# Altium schematic sheet Connection_scheme.SchDoc: =DT_SCH_Title
size A3; Organization: Droid Technologies; SheetNumber: 2; SheetTotal: 22
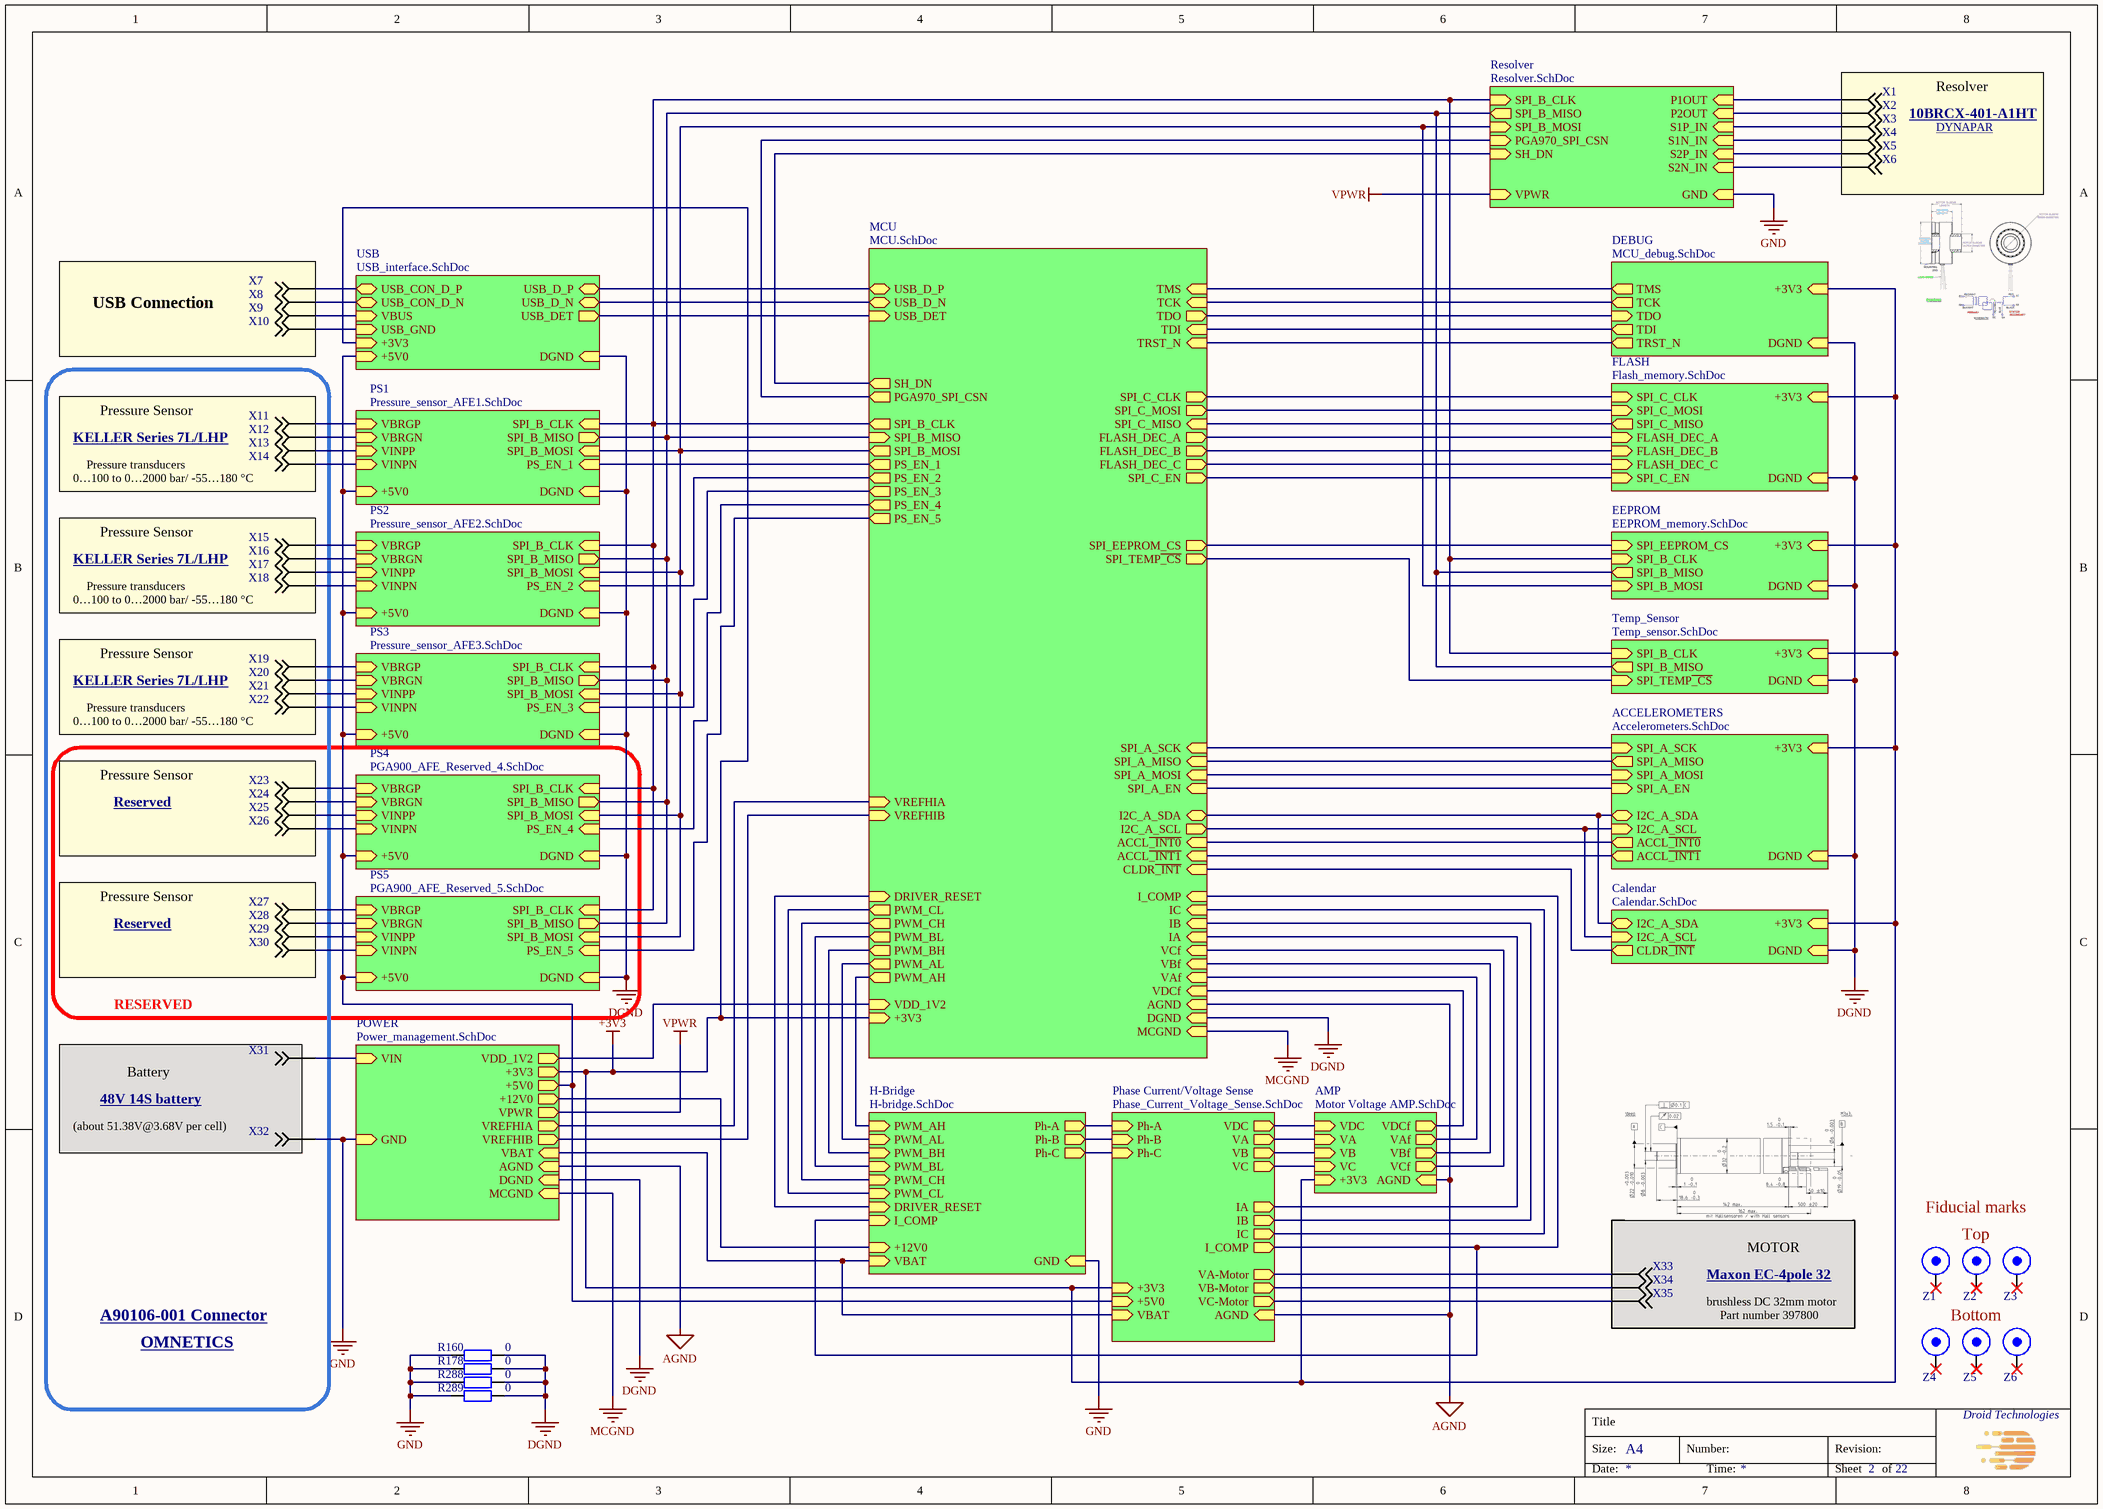
[diagram p0: Connection_scheme.SchDoc]

## Parts
R160  Resistance: 0  [RESC160X80X55L30]  (hidden comment: RC0603FR-070RL)
R178  Resistance: 0  [RESC160X80X55L30]  (hidden comment: RC0603FR-070RL)
R288  Resistance: 0  [RESC160X80X55L30]  (hidden comment: RC0603FR-070RL)
R289  Resistance: 0  [RESC160X80X55L30]  (hidden comment: RC0603FR-070RL)
X1  PIN-TH-0.6mm  [PIN-TH-0.6mm]  (value not drawn)  (no BOM)
X2  PIN-TH-0.6mm  [PIN-TH-0.6mm]  (value not drawn)  (no BOM)
X3  PIN-TH-0.6mm  [PIN-TH-0.6mm]  (value not drawn)  (no BOM)
X4  PIN-TH-0.6mm  [PIN-TH-0.6mm]  (value not drawn)  (no BOM)
X5  PIN-TH-0.6mm  [PIN-TH-0.6mm]  (value not drawn)  (no BOM)
X6  PIN-TH-0.6mm  [PIN-TH-0.6mm]  (value not drawn)  (no BOM)
X7  PIN-TH-0.6mm  [PIN-TH-0.6mm]  (value not drawn)  (no BOM)
X8  PIN-TH-0.6mm  [PIN-TH-0.6mm]  (value not drawn)  (no BOM)
X9  PIN-TH-0.6mm  [PIN-TH-0.6mm]  (value not drawn)  (no BOM)
X10  PIN-TH-0.6mm  [PIN-TH-0.6mm]  (value not drawn)  (no BOM)
X11  PIN-TH-0.6mm  [PIN-TH-0.6mm]  (value not drawn)  (no BOM)
X12  PIN-TH-0.6mm  [PIN-TH-0.6mm]  (value not drawn)  (no BOM)
X13  PIN-TH-0.6mm  [PIN-TH-0.6mm]  (value not drawn)  (no BOM)
X14  PIN-TH-0.6mm  [PIN-TH-0.6mm]  (value not drawn)  (no BOM)
X15  PIN-TH-0.6mm  [PIN-TH-0.6mm]  (value not drawn)  (no BOM)
X16  PIN-TH-0.6mm  [PIN-TH-0.6mm]  (value not drawn)  (no BOM)
X17  PIN-TH-0.6mm  [PIN-TH-0.6mm]  (value not drawn)  (no BOM)
X18  PIN-TH-0.6mm  [PIN-TH-0.6mm]  (value not drawn)  (no BOM)
X19  PIN-TH-0.6mm  [PIN-TH-0.6mm]  (value not drawn)  (no BOM)
X20  PIN-TH-0.6mm  [PIN-TH-0.6mm]  (value not drawn)  (no BOM)
X21  PIN-TH-0.6mm  [PIN-TH-0.6mm]  (value not drawn)  (no BOM)
X22  PIN-TH-0.6mm  [PIN-TH-0.6mm]  (value not drawn)  (no BOM)
X23  PIN-TH-0.6mm  [PIN-TH-0.6mm]  (value not drawn)  (no BOM)
X24  PIN-TH-0.6mm  [PIN-TH-0.6mm]  (value not drawn)  (no BOM)
X25  PIN-TH-0.6mm  [PIN-TH-0.6mm]  (value not drawn)  (no BOM)
X26  PIN-TH-0.6mm  [PIN-TH-0.6mm]  (value not drawn)  (no BOM)
X27  PIN-TH-0.6mm  [PIN-TH-0.6mm]  (value not drawn)  (no BOM)
X28  PIN-TH-0.6mm  [PIN-TH-0.6mm]  (value not drawn)  (no BOM)
X29  PIN-TH-0.6mm  [PIN-TH-0.6mm]  (value not drawn)  (no BOM)
X30  PIN-TH-0.6mm  [PIN-TH-0.6mm]  (value not drawn)  (no BOM)
X31  PinTH_0.9mm  [PIN-TH-0.9mm]  (value not drawn)  (no BOM)
X32  PinTH_0.9mm  [PIN-TH-0.9mm]  (value not drawn)  (no BOM)
X33  PinTH_0.9mm  [PIN-TH-0.9mm]  (value not drawn)  (no BOM)
X34  PinTH_0.9mm  [PIN-TH-0.9mm]  (value not drawn)  (no BOM)
X35  PinTH_0.9mm  [PIN-TH-0.9mm]  (value not drawn)  (no BOM)
Z1  Fiducial  [REPER1.2]  (value not drawn)  (no BOM)
Z2  Fiducial  [REPER1.2]  (value not drawn)  (no BOM)
Z3  Fiducial  [REPER1.2]  (value not drawn)  (no BOM)
Z4  Fiducial  [REPER1.2]  (value not drawn)  (no BOM)
Z5  Fiducial  [REPER1.2]  (value not drawn)  (no BOM)
Z6  Fiducial  [REPER1.2]  (value not drawn)  (no BOM)

## Blocks framed on the sheet
USB Connection: X7-X10

## Sub-sheets
ACCELEROMETERS = Accelerometers.SchDoc: SPI_A_EN (in), SPI_A_MISO (out), SPI_A_MOSI (in), SPI_A_SCK (in), ACCL~{_INT0} (out), ACCL~{_INT1} (out), +3V3 (in), DGND (in), I2C_A_SCL (in), I2C_A_SDA (bidir)
AMP = Motor Voltage AMP.SchDoc: VA (in), VB (in), VC (in), VDC (in), VAf (out), VBf (out), VCf (out), VDCf (out), +3V3 (in), AGND (in)
Calendar = Calendar.SchDoc: CLDR~{_INT} (out), +3V3 (in), DGND (in), I2C_A_SCL (in), I2C_A_SDA (bidir)
DEBUG = MCU_debug.SchDoc: +3V3 (in), TMS (out), TCK (out), TDO (in), TDI (out), TRST_N (out), DGND (in)
EEPROM = EEPROM_memory.SchDoc: SPI_EEPROM_CS (in), SPI_B_CLK (in), SPI_B_MOSI (in), SPI_B_MISO (out), +3V3 (in), DGND (in)
FLASH = Flash_memory.SchDoc: SPI_C_CLK (in), SPI_C_MOSI (in), SPI_C_MISO (out), FLASH_DEC_A (in), FLASH_DEC_B (in), FLASH_DEC_C (in), SPI_C_EN (in), +3V3 (in), DGND (in)
H-Bridge = H-bridge.SchDoc: PWM_AH (in), PWM_AL (in), PWM_BH (in), PWM_BL (in), PWM_CH (in), PWM_CL (in), DRIVER_RESET (in), +12V0 (in), VBAT (in), Ph-A (out), Ph-B (out), Ph-C (out), GND (in), I_COMP (in)
MCU = MCU.SchDoc: TMS (in), TCK (in), TDO (out), TDI (in), TRST_N (in), +3V3 (in), DGND (in), USB_D_P (bidir), USB_D_N (bidir), VAf (in), VBf (in), VCf (in), IA (in), IB (in), IC (in), I_COMP (in), VDCf (in), PS_EN_1 (out), SPI_B_CLK (out), SPI_B_MISO (in), SPI_B_MOSI (out), PS_EN_2 (out), PS_EN_3 (out), SPI_C_CLK (out), SPI_C_MOSI (out), SPI_C_MISO (in), FLASH_DEC_A (out), FLASH_DEC_B (out), FLASH_DEC_C (out), SPI_C_EN (out), I2C_A_SCL (out), I2C_A_SDA (bidir), ACCL~{_INT1} (in), ACCL~{_INT0} (in), CLDR~{_INT} (in), VREFHIA (in), VREFHIB (in), PWM_AH (out), PWM_AL (out), PWM_BH (out), PWM_BL (out), PWM_CH (out), PWM_CL (out), DRIVER_RESET (in), PS_EN_4 (out), PS_EN_5 (out), USB_DET (in), VDD_1V2 (in), SH_DN (out), PGA970_SPI_CSN (out), SPI_A_EN (in), SPI_A_MISO (in), SPI_A_MOSI (in), SPI_A_SCK (in), SPI_EEPROM_CS (out), SPI_TEMP~{_CS} (out), AGND (in), MCGND (in)
Phase Current/Voltage Sense = Phase_Current_Voltage_Sense.SchDoc: Ph-A (in), Ph-B (in), Ph-C (in), VA (out), VB (out), VC (out), IA (out), IB (out), IC (out), VA-Motor (out), VB-Motor (out), VC-Motor (out), +5V0 (in), VBAT (in), +3V3 (in), I_COMP (out), AGND (in), VDC (out)
POWER = Power_management.SchDoc: GND (in), VPWR (out), +3V3 (out), VDD_1V2 (out), +5V0 (out), +12V0 (out), VIN (in), VREFHIA (out), VREFHIB (out), VBAT (in), MCGND (in), AGND (in), DGND (in)
PS1 = Pressure_sensor_AFE1.SchDoc: PS_EN_1 (in), SPI_B_CLK (in), SPI_B_MISO (out), SPI_B_MOSI (in), VBRGP (in), VBRGN (in), VINPP (in), VINPN (in), DGND (in), +5V0 (in)
PS2 = Pressure_sensor_AFE2.SchDoc: PS_EN_2 (in), SPI_B_CLK (in), SPI_B_MISO (out), SPI_B_MOSI (in), VBRGP (in), VBRGN (in), VINPP (in), VINPN (in), DGND (in), +5V0 (in)
PS3 = Pressure_sensor_AFE3.SchDoc: PS_EN_3 (in), SPI_B_CLK (in), SPI_B_MISO (out), SPI_B_MOSI (in), VBRGP (in), VBRGN (in), VINPP (in), VINPN (in), DGND (in), +5V0 (in)
PS4 = PGA900_AFE_Reserved_4.SchDoc: PS_EN_4 (in), SPI_B_CLK (in), SPI_B_MISO (out), SPI_B_MOSI (in), VBRGP (in), VBRGN (in), VINPP (in), VINPN (in), DGND (in), +5V0 (in)
PS5 = PGA900_AFE_Reserved_5.SchDoc: PS_EN_5 (in), SPI_B_CLK (in), SPI_B_MISO (out), SPI_B_MOSI (in), VBRGP (in), VBRGN (in), VINPP (in), VINPN (in), DGND (in), +5V0 (in)
Resolver = Resolver.SchDoc: PGA970_SPI_CSN (in), SPI_B_CLK (in), SPI_B_MISO (out), SPI_B_MOSI (in), SH_DN (in), GND (in), VPWR (in), P1OUT (in), P2OUT (in), S1P_IN (in), S1N_IN (in), S2P_IN (in), S2N_IN (in)
Temp_Sensor = Temp_sensor.SchDoc: SPI_TEMP~{_CS} (in), SPI_B_MISO (out), SPI_B_CLK (in), +3V3 (in), DGND (in)
USB = USB_interface.SchDoc: USB_CON_D_P (bidir), USB_CON_D_N (bidir), USB_D_P (bidir), USB_D_N (bidir), USB_DET (out), VBUS (in), DGND (in), USB_GND (in), +5V0 (in), +3V3 (in)

## Nets
+3V3: sheet MCU/+3V3, sheet DEBUG/+3V3, sheet FLASH/+3V3, sheet EEPROM/+3V3, sheet Temp_Sensor/+3V3, sheet ACCELEROMETERS/+3V3, sheet Phase Current/Voltage Sense/+3V3, sheet Calendar/+3V3, sheet USB/+3V3, sheet POWER/+3V3, sheet AMP/+3V3
AGND: sheet MCU/AGND, sheet Phase Current/Voltage Sense/AGND, sheet POWER/AGND, sheet AMP/AGND
DGND: R160.1 R178.1 R288.1 R289.1 ; sheet MCU/DGND, sheet DEBUG/DGND, sheet FLASH/DGND, sheet EEPROM/DGND, sheet Temp_Sensor/DGND, sheet ACCELEROMETERS/DGND, sheet PS1/DGND, sheet Calendar/DGND, sheet USB/DGND, sheet POWER/DGND, sheet PS2/DGND, sheet PS3/DGND, sheet PS4/DGND, sheet PS5/DGND
GND: R160.2 R178.2 R288.2 R289.2 X32.1 ; sheet H-Bridge/GND, sheet Resolver/GND, sheet POWER/GND
MCGND: sheet MCU/MCGND, sheet POWER/MCGND
VPWR: sheet Resolver/VPWR, sheet POWER/VPWR
NetX1_1: X1.1 ; sheet Resolver/P1OUT
NetX2_1: X2.1 ; sheet Resolver/P2OUT
NetX3_1: X3.1 ; sheet Resolver/S1P_IN
NetX4_1: X4.1 ; sheet Resolver/S1N_IN
NetX5_1: X5.1 ; sheet Resolver/S2P_IN
NetX6_1: X6.1 ; sheet Resolver/S2N_IN
NetX7_1: X7.1 ; sheet USB/USB_CON_D_P
NetX8_1: X8.1 ; sheet USB/USB_CON_D_N
NetX9_1: X9.1 ; sheet USB/VBUS
NetX10_1: X10.1 ; sheet USB/USB_GND
NetX11_1: X11.1 ; sheet PS1/VBRGP
NetX12_1: X12.1 ; sheet PS1/VBRGN
NetX13_1: X13.1 ; sheet PS1/VINPP
NetX14_1: X14.1 ; sheet PS1/VINPN
NetX15_1: X15.1 ; sheet PS2/VBRGP
NetX16_1: X16.1 ; sheet PS2/VBRGN
NetX17_1: X17.1 ; sheet PS2/VINPP
NetX18_1: X18.1 ; sheet PS2/VINPN
NetX19_1: X19.1 ; sheet PS3/VBRGP
NetX20_1: X20.1 ; sheet PS3/VBRGN
NetX21_1: X21.1 ; sheet PS3/VINPP
NetX22_1: X22.1 ; sheet PS3/VINPN
NetX23_1: X23.1 ; sheet PS4/VBRGP
NetX24_1: X24.1 ; sheet PS4/VBRGN
NetX25_1: X25.1 ; sheet PS4/VINPP
NetX26_1: X26.1 ; sheet PS4/VINPN
NetX27_1: X27.1 ; sheet PS5/VBRGP
NetX28_1: X28.1 ; sheet PS5/VBRGN
NetX29_1: X29.1 ; sheet PS5/VINPP
NetX30_1: X30.1 ; sheet PS5/VINPN
NetX31_1: X31.1 ; sheet POWER/VIN
NetX33_1: X33.1 ; sheet Phase Current/Voltage Sense/VA-Motor
NetX34_1: X34.1 ; sheet Phase Current/Voltage Sense/VB-Motor
NetX35_1: X35.1 ; sheet Phase Current/Voltage Sense/VC-Motor
(unnamed): sheet MCU/TMS, sheet DEBUG/TMS
(unnamed): sheet MCU/TCK, sheet DEBUG/TCK
(unnamed): sheet MCU/TDO, sheet DEBUG/TDO
(unnamed): sheet MCU/TDI, sheet DEBUG/TDI
(unnamed): sheet MCU/TRST_N, sheet DEBUG/TRST_N
(unnamed): sheet MCU/USB_D_P, sheet USB/USB_D_P
(unnamed): sheet MCU/USB_D_N, sheet USB/USB_D_N
(unnamed): sheet MCU/VAf, sheet AMP/VAf
(unnamed): sheet MCU/VBf, sheet AMP/VBf
(unnamed): sheet MCU/VCf, sheet AMP/VCf
(unnamed): sheet MCU/IA, sheet Phase Current/Voltage Sense/IA
(unnamed): sheet MCU/IB, sheet Phase Current/Voltage Sense/IB
(unnamed): sheet MCU/IC, sheet Phase Current/Voltage Sense/IC
(unnamed): sheet MCU/I_COMP, sheet H-Bridge/I_COMP, sheet Phase Current/Voltage Sense/I_COMP
(unnamed): sheet MCU/VDCf, sheet AMP/VDCf
(unnamed): sheet MCU/PS_EN_1, sheet PS1/PS_EN_1
(unnamed): sheet MCU/SPI_B_CLK, sheet EEPROM/SPI_B_CLK, sheet Temp_Sensor/SPI_B_CLK, sheet Resolver/SPI_B_CLK, sheet PS1/SPI_B_CLK, sheet PS2/SPI_B_CLK, sheet PS3/SPI_B_CLK, sheet PS4/SPI_B_CLK, sheet PS5/SPI_B_CLK
(unnamed): sheet MCU/SPI_B_MISO, sheet EEPROM/SPI_B_MISO, sheet Temp_Sensor/SPI_B_MISO, sheet Resolver/SPI_B_MISO, sheet PS1/SPI_B_MISO, sheet PS2/SPI_B_MISO, sheet PS3/SPI_B_MISO, sheet PS4/SPI_B_MISO, sheet PS5/SPI_B_MISO
(unnamed): sheet MCU/SPI_B_MOSI, sheet EEPROM/SPI_B_MOSI, sheet Resolver/SPI_B_MOSI, sheet PS1/SPI_B_MOSI, sheet PS2/SPI_B_MOSI, sheet PS3/SPI_B_MOSI, sheet PS4/SPI_B_MOSI, sheet PS5/SPI_B_MOSI
(unnamed): sheet MCU/PS_EN_2, sheet PS2/PS_EN_2
(unnamed): sheet MCU/PS_EN_3, sheet PS3/PS_EN_3
(unnamed): sheet MCU/SPI_C_CLK, sheet FLASH/SPI_C_CLK
(unnamed): sheet MCU/SPI_C_MOSI, sheet FLASH/SPI_C_MOSI
(unnamed): sheet MCU/SPI_C_MISO, sheet FLASH/SPI_C_MISO
(unnamed): sheet MCU/FLASH_DEC_A, sheet FLASH/FLASH_DEC_A
(unnamed): sheet MCU/FLASH_DEC_B, sheet FLASH/FLASH_DEC_B
(unnamed): sheet MCU/FLASH_DEC_C, sheet FLASH/FLASH_DEC_C
(unnamed): sheet MCU/SPI_C_EN, sheet FLASH/SPI_C_EN
(unnamed): sheet MCU/I2C_A_SCL, sheet ACCELEROMETERS/I2C_A_SCL, sheet Calendar/I2C_A_SCL
(unnamed): sheet MCU/I2C_A_SDA, sheet ACCELEROMETERS/I2C_A_SDA, sheet Calendar/I2C_A_SDA
(unnamed): sheet MCU/ACCL~{_INT1}, sheet ACCELEROMETERS/ACCL~{_INT1}
(unnamed): sheet MCU/ACCL~{_INT0}, sheet ACCELEROMETERS/ACCL~{_INT0}
(unnamed): sheet MCU/CLDR~{_INT}, sheet Calendar/CLDR~{_INT}
(unnamed): sheet MCU/VREFHIA, sheet POWER/VREFHIA
(unnamed): sheet MCU/VREFHIB, sheet POWER/VREFHIB
(unnamed): sheet MCU/PWM_AH, sheet H-Bridge/PWM_AH
(unnamed): sheet MCU/PWM_AL, sheet H-Bridge/PWM_AL
(unnamed): sheet MCU/PWM_BH, sheet H-Bridge/PWM_BH
(unnamed): sheet MCU/PWM_BL, sheet H-Bridge/PWM_BL
(unnamed): sheet MCU/PWM_CH, sheet H-Bridge/PWM_CH
(unnamed): sheet MCU/PWM_CL, sheet H-Bridge/PWM_CL
(unnamed): sheet MCU/DRIVER_RESET, sheet H-Bridge/DRIVER_RESET
(unnamed): sheet MCU/PS_EN_4, sheet PS4/PS_EN_4
(unnamed): sheet MCU/PS_EN_5, sheet PS5/PS_EN_5
(unnamed): sheet MCU/USB_DET, sheet USB/USB_DET
(unnamed): sheet MCU/VDD_1V2, sheet POWER/VDD_1V2
(unnamed): sheet MCU/SH_DN, sheet Resolver/SH_DN
(unnamed): sheet MCU/PGA970_SPI_CSN, sheet Resolver/PGA970_SPI_CSN
(unnamed): sheet MCU/SPI_A_EN, sheet ACCELEROMETERS/SPI_A_EN
(unnamed): sheet MCU/SPI_A_MISO, sheet ACCELEROMETERS/SPI_A_MISO
(unnamed): sheet MCU/SPI_A_MOSI, sheet ACCELEROMETERS/SPI_A_MOSI
(unnamed): sheet MCU/SPI_A_SCK, sheet ACCELEROMETERS/SPI_A_SCK
(unnamed): sheet MCU/SPI_EEPROM_CS, sheet EEPROM/SPI_EEPROM_CS
(unnamed): sheet MCU/SPI_TEMP~{_CS}, sheet Temp_Sensor/SPI_TEMP~{_CS}
(unnamed): sheet H-Bridge/+12V0, sheet POWER/+12V0
(unnamed): sheet H-Bridge/VBAT, sheet Phase Current/Voltage Sense/VBAT, sheet POWER/VBAT
(unnamed): sheet H-Bridge/Ph-A, sheet Phase Current/Voltage Sense/Ph-A
(unnamed): sheet H-Bridge/Ph-B, sheet Phase Current/Voltage Sense/Ph-B
(unnamed): sheet H-Bridge/Ph-C, sheet Phase Current/Voltage Sense/Ph-C
(unnamed): sheet Phase Current/Voltage Sense/VA, sheet AMP/VA
(unnamed): sheet Phase Current/Voltage Sense/VB, sheet AMP/VB
(unnamed): sheet Phase Current/Voltage Sense/VC, sheet AMP/VC
(unnamed): sheet Phase Current/Voltage Sense/+5V0, sheet PS1/+5V0, sheet USB/+5V0, sheet POWER/+5V0, sheet PS2/+5V0, sheet PS3/+5V0, sheet PS4/+5V0, sheet PS5/+5V0
(unnamed): sheet Phase Current/Voltage Sense/VDC, sheet AMP/VDC

Not connected (* = marked no-connect by the designer): Z1 1*; Z2 1*; Z3 1*; Z4 1*; Z5 1*; Z6 1*

## Notes on the sheet
- 10BRCX-401-A1HT <https://www.dynapar.com/hubfs/uploadedFiles/_site_root/Products_and_Solutions/Frameless09072012C_Pamp.pdf?hsLang=en>
- Resolver
- DYNAPAR <https://www.dynapar.com/Products_and_Solutions/Resolvers/Frameless/>
- KELLER Series 7L/LHP <https://download.keller-pressure.com/api/download/C88AJ8DXftpGtXGN9dXUXE/en/2023-07.pdf>
- Pressure Sensor
- 0…100 to 0…2000 bar/ -55…180 °C
- Pressure transducers
- Reserved <https://download.keller-pressure.com/api/download/C88AJ8DXftpGtXGN9dXUXE/en/2023-07.pdf>
- RESERVED
- (near X32) (about 51.38V@3.68V per cell)
- 48V 14S battery <https://www.chargerind.com/batteries>
- Battery
- MOTOR
- Fiducial marks
- Top
- A90106-001 Connector <https://www.omnetics.com/wp-content/uploads/2022/01/A90106-001.pdf>
- Maxon EC-4pole 32 <https://www.maxongroup.us/maxon/view/product/motor/ecmotor/ec4pole/397800>
- brushless DC 32mm motor
- Part number 397800
- Bottom
- OMNETICS <https://www.omnetics.com/product/a90106-001/>
- Title
- Size:
- A4
- Number:
- Revision:
- Date:
- Time:
- Sheet
- of

## Library data of the parts
R160 R178 R288 R289 = CMP-001-0927-2: RES 0 OHM JUMPER 1/10W 0603; Manufacturer: YAGEO; Op Temp min: -55°C; Op Temp max: 155°C; Power: 100mW; Tolerance: 0%; Height max: 550µm; ComponentLink2URL: https://eu.mouser.com/ProductDetail/YAGEO/RC0603FR-070RL?qs=0yPvnVz5%2FmpDQv43TwvCfw%3D%3D; Temperature Coefficient: -; ComponentLink3Description: Digikey; ComponentLink2Description: Mouser; MPN: RC0603FR-070RL; ComponentLink1URL: https://www.yageo.com/upload/media/product/productsearch/datasheet/rchip/PYu-RC_Group_51_RoHS_L_12.pdf; Ratings: -; Size: 1.60mm x 0.80mm; Composition: Thick Film; Mounting Type: SM; ComponentLink3URL: https://www.digikey.com/en/products/detail/yageo/RC0603FR-070RL/1304008; Package: 0603 (1608 Metric); ComponentLink1Description: Datasheet
X1-X30 = PinTH_0.6mm: Pin 0.6mm diameter for 26AWG; Current Rating (Amps): 3A; Voltage Rating: 250V; ComponentLink1Description: DigiKey; ComponentLink2Description: Datasheet; Termination: Solder; Mounting Type: TH; Diameter: 0.6mm; Contact Type: Male Pin; ComponentLink3Description: Mouser
X31-X35 = PinTH_0.9mm: Pin 1.0mm diameter for 20AWG; Current Rating (Amps): 3A; Voltage Rating: 250V; ComponentLink1Description: DigiKey; ComponentLink2Description: Datasheet; Termination: Solder; Mounting Type: TH; Diameter: 0.9mm; Contact Type: Male Pin; ComponentLink3Description: Mouser
Z1-Z6 = Fiducial: MPN: Fiducail